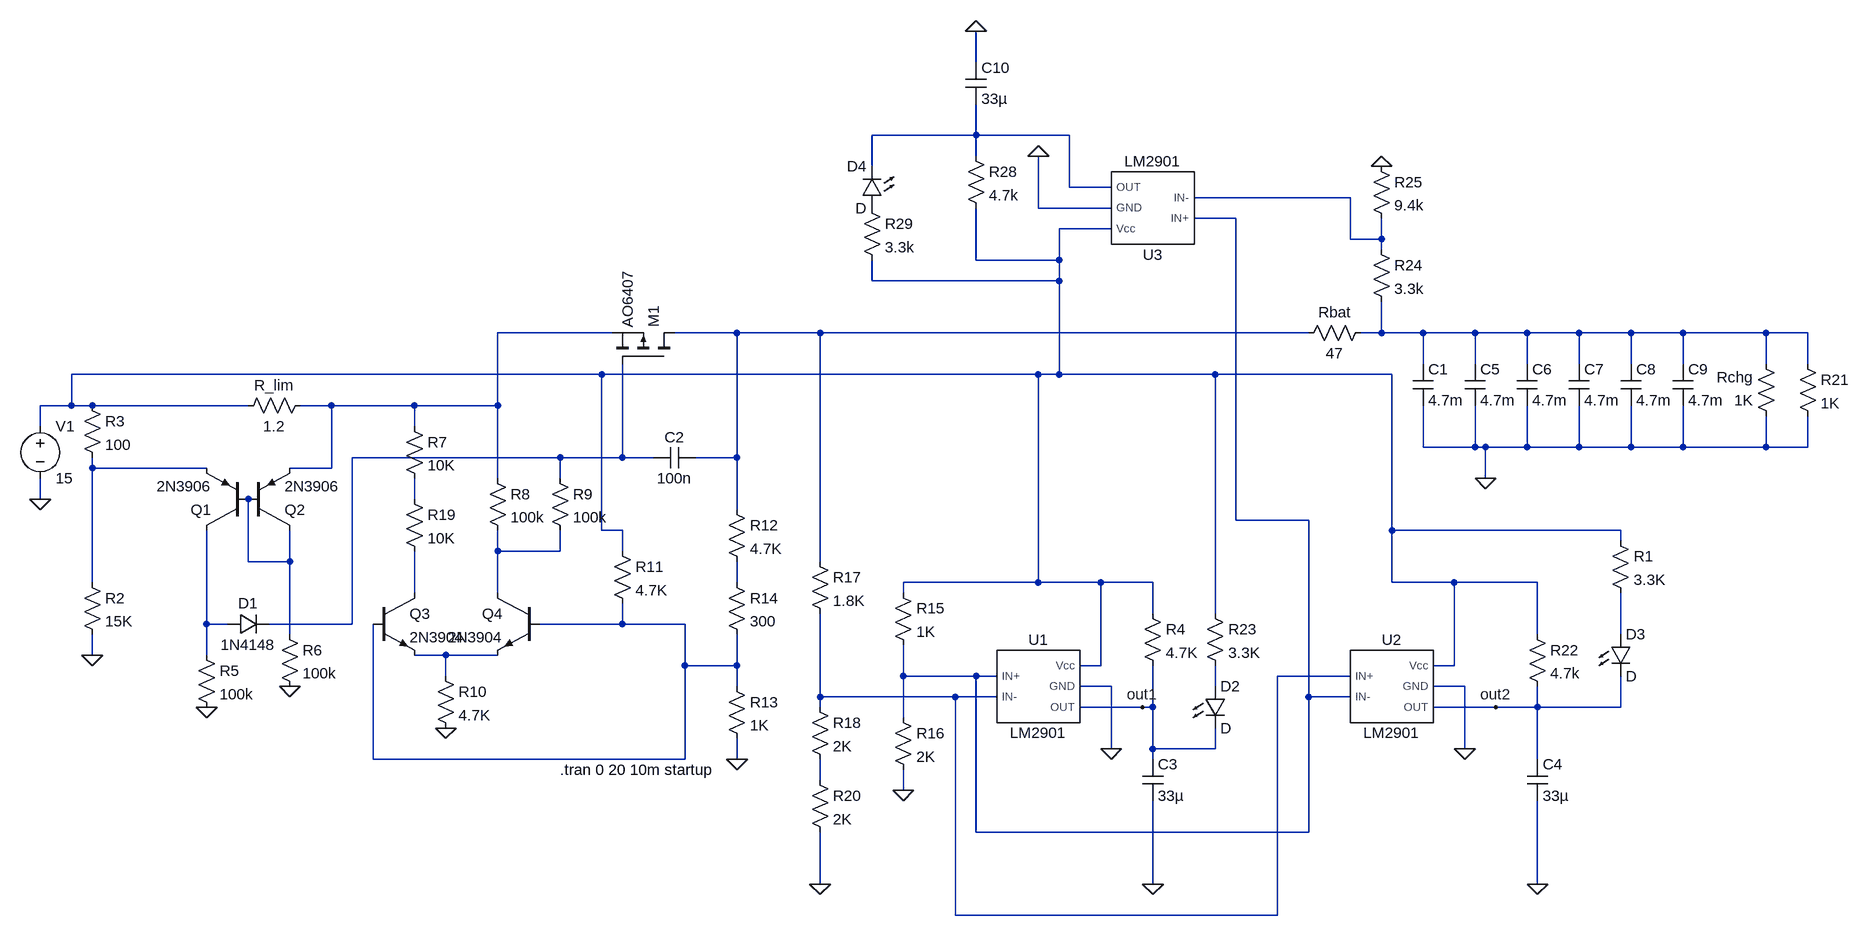
[diagram p0: schematic CC_CV_running.asc]
CC_CV_running.asc, the LTspice schematic file:
Version 4.1
SHEET 1 2868 680
WIRE 944 -784 944 -832
WIRE 944 -672 944 -720
WIRE 944 -672 784 -672
WIRE 1088 -672 944 -672
WIRE 944 -640 944 -672
WIRE 784 -624 784 -672
WIRE 1088 -592 1088 -672
WIRE 1152 -592 1088 -592
WIRE 1520 -576 1280 -576
WIRE 1040 -560 1040 -640
WIRE 1152 -560 1040 -560
WIRE 1344 -544 1280 -544
WIRE 1152 -528 1072 -528
WIRE 1520 -512 1520 -576
WIRE 1568 -512 1568 -544
WIRE 1568 -512 1520 -512
WIRE 1568 -496 1568 -512
WIRE 944 -480 944 -560
WIRE 1072 -480 1072 -528
WIRE 1072 -480 944 -480
WIRE 784 -448 784 -480
WIRE 1072 -448 1072 -480
WIRE 1072 -448 784 -448
WIRE 384 -368 208 -368
WIRE 576 -368 480 -368
WIRE 704 -368 576 -368
WIRE 1456 -368 704 -368
WIRE 1568 -368 1568 -416
WIRE 1568 -368 1536 -368
WIRE 1632 -368 1568 -368
WIRE 1712 -368 1632 -368
WIRE 1792 -368 1712 -368
WIRE 1872 -368 1792 -368
WIRE 1952 -368 1872 -368
WIRE 2032 -368 1952 -368
WIRE 2160 -368 2032 -368
WIRE 2224 -368 2160 -368
WIRE 1632 -320 1632 -368
WIRE 1712 -320 1712 -368
WIRE 1792 -320 1792 -368
WIRE 1872 -320 1872 -368
WIRE 1952 -320 1952 -368
WIRE 2032 -320 2032 -368
WIRE 2160 -320 2160 -368
WIRE 2224 -320 2224 -368
WIRE 368 -304 -448 -304
WIRE 1040 -304 368 -304
WIRE 1072 -304 1072 -448
WIRE 1072 -304 1040 -304
WIRE 1312 -304 1072 -304
WIRE 1584 -304 1312 -304
WIRE -448 -256 -448 -304
WIRE -448 -256 -496 -256
WIRE -416 -256 -448 -256
WIRE -176 -256 -416 -256
WIRE -48 -256 -96 -256
WIRE 80 -256 -48 -256
WIRE 208 -256 208 -368
WIRE 208 -256 80 -256
WIRE -496 -224 -496 -256
WIRE 80 -224 80 -256
WIRE 1632 -192 1632 -256
WIRE 1712 -192 1712 -256
WIRE 1712 -192 1632 -192
WIRE 1728 -192 1712 -192
WIRE 1792 -192 1792 -256
WIRE 1792 -192 1728 -192
WIRE 1872 -192 1872 -256
WIRE 1872 -192 1792 -192
WIRE 1952 -192 1952 -256
WIRE 1952 -192 1872 -192
WIRE 2032 -192 2032 -256
WIRE 2032 -192 1952 -192
WIRE 2160 -192 2160 -240
WIRE 2160 -192 2032 -192
WIRE 2224 -192 2224 -240
WIRE 2224 -192 2160 -192
WIRE 304 -176 -16 -176
WIRE 400 -176 400 -320
WIRE 400 -176 304 -176
WIRE 448 -176 400 -176
WIRE 576 -176 576 -368
WIRE 576 -176 512 -176
WIRE -416 -160 -416 -176
WIRE -240 -160 -416 -160
WIRE -48 -160 -48 -256
WIRE -48 -160 -112 -160
WIRE 208 -144 208 -256
WIRE 304 -144 304 -176
WIRE 1728 -144 1728 -192
WIRE -496 -112 -496 -144
WIRE 80 -112 80 -144
WIRE 576 -96 576 -176
WIRE 1344 -80 1344 -544
WIRE 1456 -80 1344 -80
WIRE 368 -64 368 -304
WIRE 400 -64 368 -64
WIRE 1584 -64 1584 -304
WIRE 1936 -64 1584 -64
WIRE 1936 -48 1936 -64
WIRE 208 -32 208 -64
WIRE 304 -32 304 -64
WIRE 304 -32 208 -32
WIRE 400 -32 400 -64
WIRE -176 -16 -176 -112
WIRE -112 -16 -112 -64
WIRE -112 -16 -176 -16
WIRE 704 -16 704 -368
WIRE -416 16 -416 -160
WIRE 576 16 576 -16
WIRE 1040 16 1040 -304
WIRE 1040 16 832 16
WIRE 1136 16 1040 16
WIRE 1216 16 1136 16
WIRE 1584 16 1584 -64
WIRE 1680 16 1584 16
WIRE 1808 16 1680 16
WIRE 80 32 80 -32
WIRE 208 32 208 -32
WIRE 832 32 832 16
WIRE 1216 64 1216 16
WIRE 1312 64 1312 -304
WIRE -240 80 -240 -64
WIRE -208 80 -240 80
WIRE -16 80 -16 -176
WIRE -16 80 -144 80
WIRE 400 80 400 48
WIRE 400 80 272 80
WIRE 496 80 400 80
WIRE -112 96 -112 -16
WIRE 1808 96 1808 16
WIRE 1936 96 1936 32
WIRE -416 128 -416 96
WIRE -240 128 -240 80
WIRE 128 128 80 128
WIRE 208 128 128 128
WIRE 496 144 496 80
WIRE 576 144 576 96
WIRE 576 144 496 144
WIRE 1136 144 1136 16
WIRE 1136 144 1104 144
WIRE 1680 144 1680 16
WIRE 1680 144 1648 144
WIRE 128 160 128 128
WIRE 832 160 832 112
WIRE 944 160 832 160
WIRE 976 160 944 160
WIRE 1520 160 1408 160
WIRE 576 176 576 144
WIRE 1152 176 1104 176
WIRE 1312 176 1312 144
WIRE 1696 176 1648 176
WIRE 704 192 704 64
WIRE 912 192 704 192
WIRE 976 192 912 192
WIRE 1456 192 1456 -80
WIRE 1520 192 1456 192
WIRE 704 208 704 192
WIRE 1200 208 1104 208
WIRE 1216 208 1216 144
WIRE 1216 208 1200 208
WIRE 1744 208 1648 208
WIRE 1808 208 1808 176
WIRE 1808 208 1744 208
WIRE 1936 208 1936 160
WIRE 1936 208 1808 208
WIRE 832 224 832 160
WIRE 1152 272 1152 176
WIRE 1216 272 1216 208
WIRE 1312 272 1312 240
WIRE 1312 272 1216 272
WIRE 1696 272 1696 176
WIRE 16 288 16 80
WIRE 496 288 496 144
WIRE 496 288 16 288
WIRE 576 288 576 256
WIRE 1216 288 1216 272
WIRE 1808 288 1808 208
WIRE 704 320 704 288
WIRE 832 336 832 304
WIRE 944 400 944 160
WIRE 1456 400 1456 192
WIRE 1456 400 944 400
WIRE 704 480 704 400
WIRE 1216 480 1216 352
WIRE 1808 480 1808 352
WIRE 912 528 912 192
WIRE 1408 528 1408 160
WIRE 1408 528 912 528
FLAG -496 -112 0
FLAG -416 128 0
FLAG -240 208 0
FLAG -112 176 0
FLAG 128 240 0
FLAG 576 288 0
FLAG 1728 -144 0
FLAG 832 336 0
FLAG 704 480 0
FLAG 1216 480 0
FLAG 1152 272 0
FLAG 1200 208 out1
FLAG 1696 272 0
FLAG 1744 208 out2
FLAG 1808 480 0
FLAG 1568 -624 0
FLAG 1040 -640 0
FLAG 944 -832 0
SYMBOL res -80 -272 R90
WINDOW 0 0 56 VBottom 2
WINDOW 3 32 56 VTop 2
SYMATTR InstName R_lim
SYMATTR Value 1.2
SYMBOL res 1552 -384 R90
WINDOW 0 0 56 VBottom 2
WINDOW 3 32 56 VTop 2
SYMATTR InstName Rbat
SYMATTR Value 47
SYMBOL res 2176 -224 R180
WINDOW 0 36 76 Left 2
WINDOW 3 36 40 Left 2
SYMATTR InstName Rchg
SYMATTR Value 1K
SYMBOL cap 1616 -320 R0
SYMATTR InstName C1
SYMATTR Value 4.7m
SYMBOL pmos 480 -320 M270
SYMATTR InstName M1
SYMATTR Value AO6407
SYMBOL res -432 0 R0
SYMATTR InstName R2
SYMATTR Value 15K
SYMBOL res -432 -272 R0
SYMATTR InstName R3
SYMATTR Value 100
SYMBOL pnp -176 -64 R180
SYMATTR InstName Q1
SYMATTR Value 2N3906
SYMBOL pnp -176 -64 M180
SYMATTR InstName Q2
SYMATTR Value 2N3906
SYMBOL res -256 112 R0
SYMATTR InstName R5
SYMATTR Value 100k
SYMBOL res -128 80 R0
SYMATTR InstName R6
SYMATTR Value 100k
SYMBOL cap 512 -192 R90
WINDOW 0 0 32 VBottom 2
WINDOW 3 32 32 VTop 2
SYMATTR InstName C2
SYMATTR Value 100n
SYMBOL diode -208 96 R270
WINDOW 0 32 32 VTop 2
WINDOW 3 0 32 VBottom 2
SYMATTR InstName D1
SYMATTR Value 1N4148
SYMBOL res 192 -160 R0
SYMATTR InstName R8
SYMATTR Value 100k
SYMBOL res 288 -160 R0
SYMATTR InstName R9
SYMATTR Value 100k
SYMBOL npn 16 32 R0
SYMATTR InstName Q3
SYMATTR Value 2N3904
SYMBOL npn 272 32 M0
SYMATTR InstName Q4
SYMATTR Value 2N3904
SYMBOL res 112 144 R0
SYMATTR InstName R10
SYMATTR Value 4.7K
SYMBOL res 384 -48 R0
SYMATTR InstName R11
SYMATTR Value 4.7K
SYMBOL res 560 160 R0
SYMATTR InstName R13
SYMATTR Value 1K
SYMBOL voltage -496 -240 R0
WINDOW 123 0 0 Left 0
WINDOW 39 0 0 Left 0
SYMATTR InstName V1
SYMATTR Value 15
SYMBOL res 816 16 R0
SYMATTR InstName R15
SYMATTR Value 1K
SYMBOL res 816 208 R0
SYMATTR InstName R16
SYMATTR Value 2K
SYMBOL res 688 -32 R0
SYMATTR InstName R17
SYMATTR Value 1.8K
SYMBOL LM2901 1040 176 R0
SYMATTR InstName U1
SYMBOL res 1200 48 R0
SYMATTR InstName R4
SYMATTR Value 4.7K
SYMBOL LM2901 1584 176 R0
SYMATTR InstName U2
SYMBOL res 1792 80 R0
SYMATTR InstName R22
SYMATTR Value 4.7k
SYMBOL cap 1200 288 R0
SYMATTR InstName C3
SYMATTR Value 33µ
SYMBOL cap 1792 288 R0
SYMATTR InstName C4
SYMATTR Value 33µ
SYMBOL res 1296 48 R0
SYMATTR InstName R23
SYMATTR Value 3.3K
SYMBOL LED 1296 176 R0
SYMATTR InstName D2
SYMBOL LED 1920 96 R0
SYMATTR InstName D3
SYMBOL res 1920 -64 R0
SYMATTR InstName R1
SYMATTR Value 3.3K
SYMBOL res 560 -112 R0
SYMATTR InstName R12
SYMATTR Value 4.7K
SYMBOL res 560 0 R0
SYMATTR InstName R14
SYMATTR Value 300
SYMBOL res 64 -240 R0
SYMATTR InstName R7
SYMATTR Value 10K
SYMBOL res 64 -128 R0
SYMATTR InstName R19
SYMATTR Value 10K
SYMBOL res 688 192 R0
SYMATTR InstName R18
SYMATTR Value 2K
SYMBOL res 688 304 R0
SYMATTR InstName R20
SYMATTR Value 2K
SYMBOL res 2208 -336 R0
SYMATTR InstName R21
SYMATTR Value 1K
SYMBOL cap 1696 -320 R0
SYMATTR InstName C5
SYMATTR Value 4.7m
SYMBOL cap 1776 -320 R0
SYMATTR InstName C6
SYMATTR Value 4.7m
SYMBOL cap 1856 -320 R0
SYMATTR InstName C7
SYMATTR Value 4.7m
SYMBOL cap 1936 -320 R0
SYMATTR InstName C8
SYMATTR Value 4.7m
SYMBOL cap 2016 -320 R0
SYMATTR InstName C9
SYMATTR Value 4.7m
SYMBOL res 1552 -512 R0
SYMATTR InstName R24
SYMATTR Value 3.3k
SYMBOL res 1552 -640 R0
SYMATTR InstName R25
SYMATTR Value 9.4k
SYMBOL LM2901 1216 -560 R180
SYMATTR InstName U3
SYMBOL res 928 -656 R0
SYMATTR InstName R28
SYMATTR Value 4.7k
SYMBOL cap 928 -784 R0
SYMATTR InstName C10
SYMATTR Value 33µ
SYMBOL res 768 -576 R0
SYMATTR InstName R29
SYMATTR Value 3.3k
SYMBOL LED 800 -560 R180
WINDOW 0 24 64 Left 2
WINDOW 3 24 0 Left 2
SYMATTR InstName D4
TEXT 304 304 Left 2 !.tran 0 20 10m startup

The netlist it stands for:
* CC_CV_running.asc
R_lim N005 N004 1.2
Rbat N007 N006 47
Rchg 0 N007 1K
C1 N007 0 4.7m
M1 N006 N008 N005 N005 AO6407
R2 N009 0 15K
R3 N004 N009 100
Q1 N015 N012 N009 0 2N3906
Q2 N012 N012 N005 0 2N3906
R5 N015 0 100k
R6 N012 0 100k
C2 N006 N008 100n
D1 N015 N008 1N4148
R8 N005 N011 100k
R9 N008 N011 100k
Q3 N014 N016 N018 0 2N3904
Q4 N011 N016 N018 0 2N3904
R10 N018 0 4.7K
R11 N004 N016 4.7K
R13 N016 0 1K
V1 N004 0 15
R15 N004 N003 1K
R16 N003 0 2K
R17 N006 N019 1.8K
X§U1 N003 N019 N004 0 out1 LM2901  ; pins IN+ IN- Vcc GND OUT
R4 N004 out1 4.7K
X§U2 N019 N003 N004 0 out2 LM2901  ; pins IN+ IN- Vcc GND OUT
R22 N004 out2 4.7k
C3 out1 0 33µ
C4 out2 0 33µ
R23 N004 N020 3.3K
D2 N020 out1 D
D3 N017 out2 D
R1 N004 N017 3.3K
R12 N006 N013 4.7K
R14 N013 N016 300
R7 N005 N010 10K
R19 N010 N014 10K
R18 N019 N021 2K
R20 N021 0 2K
R21 N007 0 1K
C5 N007 0 4.7m
C6 N007 0 4.7m
C7 N007 0 4.7m
C8 N007 0 4.7m
C9 N007 0 4.7m
R24 N002 N007 3.3k
R25 0 N002 9.4k
X§U3 N003 N002 N004 0 N001 LM2901  ; pins IN+ IN- Vcc GND OUT
R28 N001 N004 4.7k
C10 0 N001 33µ
R29 P001 N004 3.3k
D4 P001 N001 D
.model D D
.lib standard.dio
.model NPN NPN
.model PNP PNP
.lib standard.bjt
.model NMOS NMOS
.model PMOS PMOS
.lib standard.mos
.tran 0 20 10m startup
.lib lm2901.lib
.backanno
.end